# EasyEDA Pro project ProPrj_K230_2026-10-28.epro, board PCB1
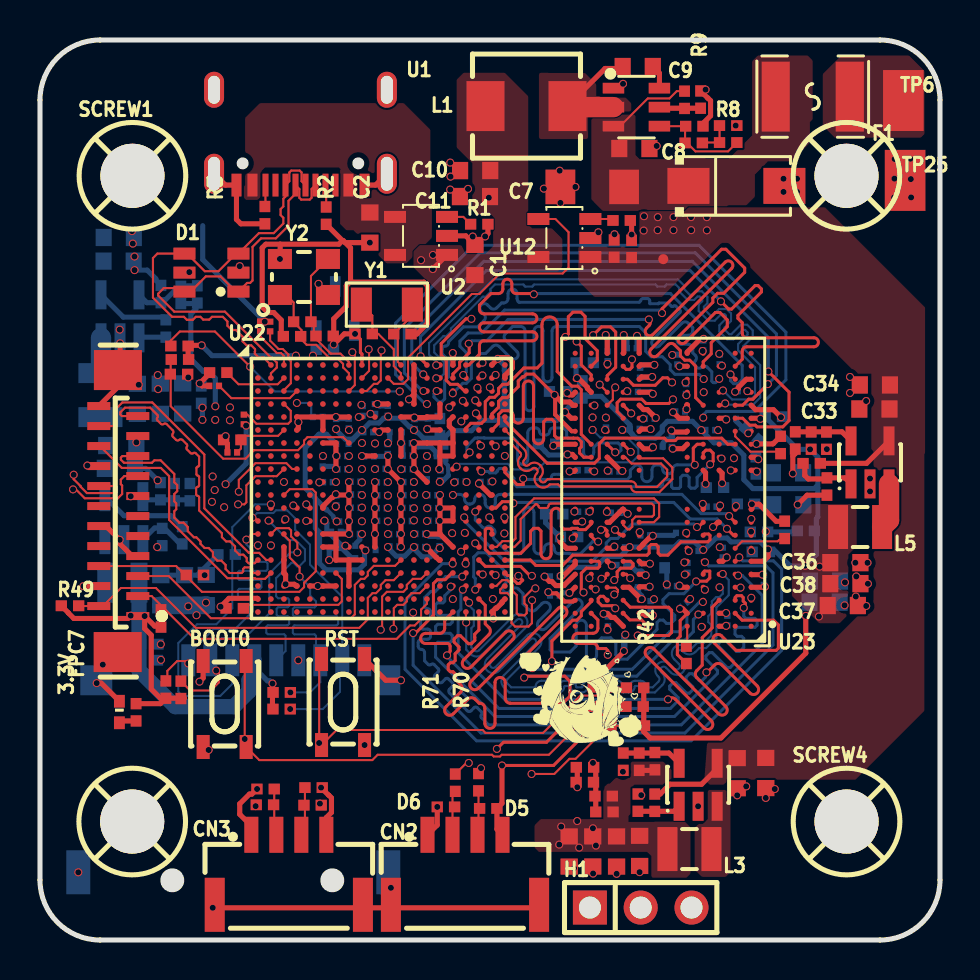
[diagram p13: board, top side]
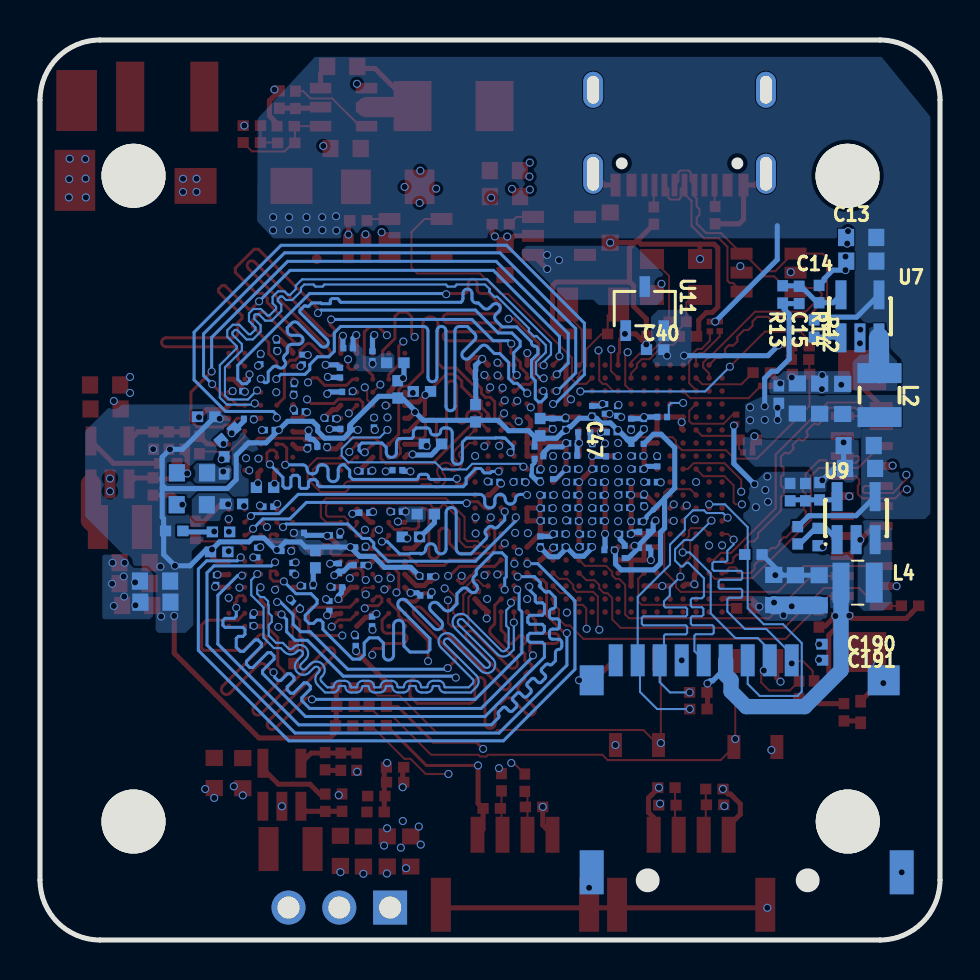
[diagram p14: board, bottom side, seen from below]

Outline 45 x 45 mm; copper layers: Top Layer, Inner1, Inner2, Inner3, Inner4, Bottom Layer. Coordinates in mm from the lower left corner of the outline.
Outline path: 0,42 0,3 arc(0.88,0.88) 3,0 42,0 arc(44.12,0.88) 45,3 45,42 arc(44.12,44.12) 42,45 3,45 arc(0.88,44.12) 0,42
Stack: Top Layer 0.035mm Outer layer thickness 1oz / Dielectric1 0.0994mm 3313 RC57% 4.2mil / Inner1 0.0152mm Inner layer thickness / Dielectric2 0.55mm 0.55mm H/H No copper / Inner2 0.0152mm Inner layer thickness / Dielectric3 0.1088mm 2116 RC54% 4.9mil / Inner3 0.0152mm Inner layer thickness / Dielectric4 0.55mm 0.55mm H/H No copper / Inner4 0.0152mm Inner layer thickness / Dielectric5 0.0994mm 3313 RC57% 4.2mil / Bottom Layer 0.035mm Outer layer thickness 1oz

## Design rules (mm)
net AVDD_0V8_PLL: PWR
net VDD0V8_CORE: PWR
net VAA_DDR: PWR
net VDD_1V8: PWR
net AVDD1P8_MIPI: PWR
net AVDD0P8_MIPI: PWR
net GND: PWR
net PRE_VDD_5V: PWR
net USB5V_IN+: PWR
net VDD_5V: PWR
net VDD_1V1: PWR
net VDD_3V3: PWR
net ADC_1V8_POWER: PWR
net DDR_VREF: PWR
net TFCARD_D1: TF_CRAD
net TFCARD_D0: TF_CRAD
net TFCARD_CLK: TF_CRAD
net TFCARD_CMD: TF_CRAD
net TFCARD_D3: TF_CRAD
net TFCARD_D2: TF_CRAD
net USB0_P: DP7
net USB0_N: DP7
net 8V-24V_IN+: PWR
net CSI2_CLK_P: DP10
net CSI2_CLK_N: DP10
net CSI2_D5_P: DP8
net CSI2_D5_N: DP8
net CSI2_D4_P: DP9
net CSI2_D4_N: DP9
net DDR_DQA6: Data_CH_A_Byte0
net DDR_DQSA0_P: Data_CH_A_Byte0, DP2
net DDR_DQA8: Data_CH_A_Byte1
net DDR_DQA7: Data_CH_A_Byte0
net DDR_DQSA0_N: Data_CH_A_Byte0, DP2
net DDR_DQA0: Data_CH_A_Byte0
net DDR_DQA13: Data_CH_A_Byte1
net DDR_DQA9: Data_CH_A_Byte1
net DDR_DQA3: Data_CH_A_Byte0
net DDR_DQA12: Data_CH_A_Byte1
net DDR_DQA11: Data_CH_A_Byte1
net DDR_DMIA1: Data_CH_A_Byte1
net DDR_DQA10: Data_CH_A_Byte1
net DDR_CSA0: CMD_ADDR_CH_A
net DDR_CLKA_N: CMD_ADDR_CH_A, DP3
net DDR_CLKA_P: CMD_ADDR_CH_A, DP3
net DDR_CAA5: CMD_ADDR_CH_A
net DDR_DQA14: Data_CH_A_Byte1
net DDR_DQA2: Data_CH_A_Byte0
net DDR_DQA4: Data_CH_A_Byte0
net DDR_DQA15: Data_CH_A_Byte1
net DDR_DQA5: Data_CH_A_Byte0
net DDR_DMIA0: Data_CH_A_Byte0
net DDR_DQA1: Data_CH_A_Byte0
net DDR_DQSA1_P: Data_CH_A_Byte1, DP4
net DDR_DQSA1_N: Data_CH_A_Byte1, DP4
net DDR_CAB2: CMD_ADDR_CH_B
net DDR_CAB4: CMD_ADDR_CH_B
net DDR_CAB3: CMD_ADDR_CH_B
net DDR_DQB12: Data_CH_B_Byte1
net DDR_DQB11: Data_CH_B_Byte1
net DDR_DMIB1: Data_CH_B_Byte1
net DDR_DQB10: Data_CH_B_Byte1
net DDR_DQB13: Data_CH_B_Byte1
net DDR_DQB4: Data_CH_B_Byte0
net DDR_DQB8: Data_CH_B_Byte1
net DDR_DQB9: Data_CH_B_Byte1
net DDR_DQB6: Data_CH_B_Byte0
net DDR_DMIB0: Data_CH_B_Byte0
net DDR_DQB2: Data_CH_B_Byte0
net DDR_DQSB1_P: Data_CH_B_Byte1, DP5
net DDR_DQB7: Data_CH_B_Byte0
net DDR_DQB5: Data_CH_B_Byte0
net DDR_DQSB0_P: Data_CH_B_Byte0, DP6
net DDR_DQB3: Data_CH_B_Byte0
net DDR_DQSB1_N: Data_CH_B_Byte1, DP5
net DDR_DQB1: Data_CH_B_Byte0
net DDR_DQSB0_N: Data_CH_B_Byte0, DP6
net DDR_DQB0: Data_CH_B_Byte0
net DDR_CLKB_P: CMD_ADDR_CH_B, DP1
net DDR_CAB1: CMD_ADDR_CH_B
net DDR_CLKB_N: CMD_ADDR_CH_B, DP1
net DDR_CAB5: CMD_ADDR_CH_B
net DDR_CAB0: CMD_ADDR_CH_B
net DDR_DQB14: Data_CH_B_Byte1
net DDR_DQB15: Data_CH_B_Byte1
net DDR_CAA1: CMD_ADDR_CH_A
net DDR_CKEA0: CMD_ADDR_CH_A
net DDR_CAA4: CMD_ADDR_CH_A
net DDR_CKEB0: CMD_ADDR_CH_B
net DDR_CAA3: CMD_ADDR_CH_A
net DDR_CAA2: CMD_ADDR_CH_A
net DDR_CAA0: CMD_ADDR_CH_A
net DDR_CSB0: CMD_ADDR_CH_B
spacing copperThickness1oz (default): track to track 0.102, other pairs 0.102 to 0.3
spacing copperThickness2oz: track to track 0.203, other pairs 0.152 to 0.3
track width copperThickness1oz (default): min 0.102, default 0.102, max 2.54
track width copperThickness2oz: min 0.203, default 0.254, max 2.54
track width DDR: min 0.127, default 0.15, max 2.54
track width Pwr: min 0.127, default 0.254, max 2.54
differential pair differentialPair (default): width min 0.025, default 0.107, max 2.54; gap min 0.152, default 0.152
net AVDD_0V8_PLL uses Pwr
net VDD0V8_CORE uses Pwr
net VAA_DDR uses Pwr
net VDD_1V8 uses Pwr, copperRegion
net AVDD1P8_MIPI uses Pwr
net AVDD0P8_MIPI uses Pwr
net GND uses Pwr, copperRegion
net PRE_VDD_5V uses Pwr
net USB5V_IN+ uses Pwr
net VDD_5V uses Pwr
net VDD_1V1 uses Pwr, copperRegion
net VDD_3V3 uses Pwr
net ADC_1V8_POWER uses Pwr
net DDR_VREF uses Pwr
net 8V-24V_IN+ uses Pwr
net $15N1275 uses copperRegion
net DDR_DQA6 uses DDR
net DDR_DQSA0_P uses DDR
net DDR_DQA8 uses DDR
net DDR_DQA7 uses DDR
net DDR_DQSA0_N uses DDR
net DDR_DQA0 uses DDR
net DDR_DQA13 uses DDR
net DDR_DQA9 uses DDR
net DDR_DQA3 uses DDR
net DDR_DQA12 uses DDR
net DDR_DQA11 uses DDR
net DDR_DMIA1 uses DDR
net DDR_DQA10 uses DDR
net DDR_CSA0 uses DDR
net DDR_CLKA_N uses DDR
net DDR_CLKA_P uses DDR
net DDR_CAA5 uses DDR
net DDR_DQA14 uses DDR
net DDR_DQA2 uses DDR
net DDR_DQA4 uses DDR
net DDR_DQA15 uses DDR
net DDR_DQA5 uses DDR
net DDR_DMIA0 uses DDR
net DDR_DQA1 uses DDR
net DDR_DQSA1_P uses DDR
net DDR_DQSA1_N uses DDR
net DDR_CAB2 uses DDR
net DDR_CAB4 uses DDR
net DDR_CAB3 uses DDR
net DDR_DQB12 uses DDR
net DDR_DQB11 uses DDR
net DDR_DMIB1 uses DDR
net DDR_DQB10 uses DDR
net DDR_DQB13 uses DDR
net DDR_DQB4 uses DDR
net DDR_DQB8 uses DDR
net DDR_DQB9 uses DDR
net DDR_DQB6 uses DDR
net DDR_DMIB0 uses DDR
net DDR_DQB2 uses DDR
net DDR_DQSB1_P uses DDR
net DDR_DQB7 uses DDR
net DDR_DQB5 uses DDR
net DDR_DQSB0_P uses DDR
net DDR_DQB3 uses DDR
net DDR_DQSB1_N uses DDR
net DDR_DQB1 uses DDR
net DDR_DQSB0_N uses DDR
net DDR_DQB0 uses DDR
net DDR_CLKB_P uses DDR
net DDR_CAB1 uses DDR
net DDR_CLKB_N uses DDR
net DDR_CAB5 uses DDR
net DDR_CAB0 uses DDR
net DDR_DQB14 uses DDR
net DDR_DQB15 uses DDR
net DDR_CAA1 uses DDR
net DDR_CKEA0 uses DDR
net DDR_CAA4 uses DDR
net DDR_CKEB0 uses DDR
net DDR_CAA3 uses DDR
net DDR_CAA2 uses DDR
net DDR_CAA0 uses DDR
net DDR_CSB0 uses DDR
net class Data_CH_A_Byte0 uses DDR
net class Data_CH_A_Byte1 uses DDR
net class Data_CH_B_Byte0 uses DDR
net class Data_CH_B_Byte1 uses DDR
net class CMD_ADDR_CH_A uses DDR
net class CMD_ADDR_CH_B uses DDR
net class PWR uses Pwr

## Placement (name value [footprint] x y rotation side)
3.3V  NCD0402R1  [LED0402-RD]  3.97 11.4 270 top
B1  BLM03PX121SN1D  [R0201_1]  17.79 25.39 90 bottom
B2  BLM03PX121SN1D  [R0201_1]  20.27 24.36 180 bottom
B3  BLM03PX121SN1D  [R0201_1]  15.12 24.81 90 bottom
B4  BLM03PX121SN1D  [R0201_1]  15.76 19.4 180 bottom
BOOT0  TSA016A2518C  [SW-SMD_4P-L4.2-W3.3-P2.15-LS4.6]  9.23 11.8 270 top
C1  10uF  [R0603]  21.75 34 90 top
C2  10uF  [R0603]  16.49 35.62 270 top
C3  100nF  [R0201]  18.37 21.61 180 bottom
C7  10uF  [C1206]  27.61 37.66 0 top
C8  100nF  [R0603]  29.72 39.57 180 top
C9  100nF  [R0603]  29.89 43.67 0 top
C10  22uF  [R0603]  21.76 38.47 0 top
C11  22uF  [R0603]  21.75 37.17 0 top
C12  75pF  [R0402]  34.41 39.87 180 top
C13  22uF  [R0603]  3.94 35.13 0 bottom
C14  22uF  [R0603]  3.93 33.94 0 bottom
C15  47pF  [R0402]  7.04 32.25 90 bottom
C16  22uF  [R0603]  7.13 27.08 90 bottom
C17  22uF  [R0603]  6.02 27.06 90 bottom
C18  22uF  [R0603]  4.87 27.06 90 bottom
C19  22uF  [R0603]  34.86 8.34 270 top
C20  22uF  [R0603]  36.29 8.35 270 top
C21  47pF  [R0402]  30.74 8.94 90 top
C22  22uF  [R0603]  28.83 4.42 270 top
C23  22uF  [R0603]  26.46 4.42 270 top
C24  22uF  [R0603]  27.64 4.43 270 top
C25  100nF  [R0402]  29.89 6.87 270 top
C26  22uF  [R0603]  4.07 24.72 0 bottom
C27  22uF  [R0603]  3.99 23.58 0 bottom
C28  47pF  [R0402]  6.73 22.39 270 bottom
C29  22uF  [R0603]  8.31 17.5 270 bottom
C30  22uF  [R0603]  6.04 17.49 270 bottom
C31  22uF  [R0603]  7.23 17.49 270 bottom
C32  100nF  [R0402]  6.11 20.15 90 bottom
C33  22uF  [R0603]  41.72 26.55 180 top
C34  22uF  [R0603]  41.74 27.75 180 top
C35  47pF  [R0402]  38.56 24.97 90 top
C36  22uF  [R0603]  40.27 18.87 0 top
C37  22uF  [R0603]  40.14 16.72 0 top
C38  22uF  [R0603]  40.27 17.82 0 top
C39  100nF  [R0402]  39.35 22.67 90 top
C40  4.7uF  [R0402]  14.24 29.52 180 bottom
C41  27pF  [R0402]  16.19 30.31 0 top
C42  27pF  [R0402]  18.12 30.3 180 top
C43  20pF  [R0402]  12.6 30.18 0 top
C44  20pF  [R0402]  14.23 30.2 180 top
C45  100nF  [R0402]  7 29.02 0 top
C46  100nF  [R0402]  28.1 12.64 180 top
C47  100nF  [R0201]  17.39 26.46 90 bottom
C48  100nF  [R0201]  33.52 25.5 0 bottom
C50  4.7uF  [R0402]  9.61 25.01 180 top
C51  100nF  [R0201]  9.61 24.38 180 top
C52  100nF  [R0201]  14.82 21.98 90 bottom
C53  100nF  [R0201]  17.72 19.68 0 bottom
C54  100nF  [R0201]  19.01 19.65 0 bottom
C55  100nF  [R0201]  19.98 19.94 90 bottom
C56  100nF  [R0201]  16.13 26.45 90 bottom
C57  100nF  [R0201]  16.75 26.55 90 bottom
C60  4.7uF  [R0402]  8.06 27.27 90 bottom
C61  100nF  [R0201]  16.46 24.18 0 bottom
C62  100nF  [R0201]  18.35 20.95 180 bottom
C63  100nF  [R0201]  15.79 21.61 180 bottom
C64  100nF  [R0201]  15.75 20.3 180 bottom
C65  100nF  [R0201]  15.11 24.2 180 bottom
C66  100nF  [R0201]  17.1 20.96 180 bottom
C67  100nF  [R0201]  17.71 20.29 0 bottom
C68  100nF  [R0201]  18.42 22.24 180 bottom
C69  100nF  [R0201]  17.09 21.59 180 bottom
C70  100nF  [R0201]  17.11 22.23 180 bottom
C71  100nF  [R0201]  18.39 23.54 0 bottom
C72  100nF  [R0201]  18.38 24.22 0 bottom
C73  100nF  [R0201]  18.41 22.9 180 bottom
C74  100nF  [R0201]  18.35 24.84 0 bottom
C75  100nF  [R0201]  19.01 20.3 0 bottom
C76  100nF  [R0201]  15.79 22.28 180 bottom
C77  100nF  [R0201]  17.09 22.88 180 bottom
C78  100nF  [R0201]  17.04 23.56 0 bottom
C79  100nF  [R0201]  15.78 22.91 180 bottom
C80  100nF  [R0201]  15.12 23.54 180 bottom
C81  22uF  [R0402]  29.58 34.56 90 top
C82  22uF  [R0402]  28.71 34.57 90 top
C83  4.7uF  [R0402]  25.71 21.3 180 bottom
C84  100nF  [R0201]  19.34 23.29 270 bottom
C85  100nF  [R0201]  19.59 24.19 0 bottom
C86  100nF  [R0201]  19.62 22.24 0 bottom
C87  100nF  [R0201]  19.67 20.96 0 bottom
C88  100nF  [R0201]  19.66 21.59 0 bottom
C89  100nF  [R0201]  17.39 24.55 270 bottom
C90  100nF  [R0201]  20.03 23.23 90 bottom
C91  100nF  [R0201]  14.14 23.92 270 bottom
C92  100nF  [R0201]  14.4 22.89 180 bottom
C93  100nF  [R0201]  16.42 25.39 0 bottom
C94  100nF  [R0201]  14.81 25.8 90 bottom
C95  100nF  [R0201]  18.73 25.8 90 bottom
C96  100nF  [R0201]  19.39 25.83 90 bottom
C97  100nF  [R0201]  15.44 25.82 90 bottom
C98  100nF  [R0402]  28.22 6.4 180 top
C99  100nF  [R0402]  27.25 8.64 180 top
C100  100nF  [R0201]  21.04 22.93 180 bottom
C101  22uF  [R0603]  39.25 17.95 0 bottom
C102  22uF  [R0603]  39.23 16.89 0 bottom
C103  4.7uF  [R0402]  19.99 25.64 90 bottom
C104  4.7uF  [R0402]  38.29 20.45 180 bottom
C105  100nF  [R0402]  36.04 19.41 180 bottom
C106  100nF  [R0402]  31.23 19.04 270 bottom
C107  100nF  [R0402]  23.22 26.33 90 bottom
C108  100nF  [R0402]  36.69 26.16 0 bottom
C109  100nF  [R0402]  27.11 27.53 90 bottom
C110  100nF  [R0201]  25.74 18.17 180 bottom
C111  100nF  [R0201]  32.68 19.46 180 bottom
C112  100nF  [R0201]  29 19.63 180 bottom
C113  100nF  [R0201]  29.74 25.55 0 bottom
C114  22uF  [R0603]  37.41 21.76 0 bottom
C115  4.7uF  [R0603]  37.4 23.36 0 bottom
C116  100nF  [R0201]  27.15 21.41 0 bottom
C117  100nF  [R0201]  33.16 29.73 90 bottom
C118  100nF  [R0201]  27.13 23.49 0 bottom
C119  100nF  [R0201]  28.73 23.43 0 bottom
C120  100nF  [R0201]  34.14 19.38 90 bottom
C121  100nF  [R0201]  29.07 18.75 0 bottom
C122  100nF  [R0201]  30.06 18.59 270 bottom
C123  100nF  [R0201]  30.13 17.63 180 bottom
C124  100nF  [R0201]  34.56 26.06 0 bottom
C125  100nF  [R0201]  28.38 29.19 90 bottom
C126  100nF  [R0201]  30.26 20.23 0 bottom
C127  100nF  [R0201]  28.79 21.36 0 bottom
C128  100nF  [R0201]  29.59 29.59 0 bottom
C129  100nF  [R0201]  25.74 17.23 180 bottom
C130  100nF  [R0201]  30 28.37 270 bottom
C131  22uF  [R0603]  29.98 4.45 270 top
C132  4.7uF  [R0402]  27.24 28.86 180 bottom
C133  100nF  [R0201]  28.4 15.93 270 bottom
C134  100nF  [R0201]  32.37 18.61 270 bottom
C135  100nF  [R0201]  31.6 17.69 180 bottom
C136  100nF  [R0201]  29.21 14.95 270 bottom
C137  100nF  [R0201]  30.53 16.7 90 bottom
C138  100nF  [R0201]  31.87 29.02 90 bottom
C139  100nF  [R0201]  28.3 25.87 270 bottom
C140  100nF  [R0201]  29.65 27.41 180 bottom
C141  100nF  [R0201]  32.3 27.55 90 bottom
C142  100nF  [R0201]  35.13 27.44 180 bottom
C143  100nF  [R0201]  33.58 21.67 180 bottom
C144  100nF  [R0201]  30.89 24.68 0 bottom
C145  100nF  [R0201]  32.04 20.36 180 bottom
C146  100nF  [R0402]  26.46 20.16 180 bottom
C147  100nF  [R0402]  35.95 20.4 0 bottom
C148  100nF  [R0402]  35.63 25.27 139 bottom
C149  100nF  [R0402]  33.75 22.62 180 bottom
C150  100nF  [R0402]  25.35 24.8 180 bottom
C151  100nF  [R0402]  35.3 21.8 180 bottom
C152  100nF  [R0402]  25.91 27.43 180 bottom
C153  100nF  [R0402]  35.79 23.73 90 bottom
C154  100nF  [R0201]  30.49 26.07 0 bottom
C155  100nF  [R0201]  34.37 15.97 270 bottom
C156  100nF  [R0201]  33.99 29.03 90 bottom
C157  100nF  [R0201]  36.19 18 90 bottom
C158  100nF  [R0201]  32.2 16.77 38.3 bottom
C159  100nF  [R0201]  32.01 26.42 0 bottom
C160  100nF  [R0201]  31.6 24.9 90 bottom
C161  100nF  [R0201]  16.54 19.5 0 bottom
C162  100nF  [R0201]  15.21 20.92 0 bottom
C163  100nF  [R0201]  14.8 20.4 180 bottom
C164  100nF  [R0201]  14.8 19.61 0 bottom
C190  10uF  [R0402]  5.47 14.79 0 bottom
C191  100nF  [R0402]  5.44 13.99 0 bottom
CARD1  XKTF-015-G  [TF-SMD_XKTF-015-N]  9.66 8.69 180 bottom
CN2  GH125-S04DCA-00  [CONN-SMD_4P-P1.27_GH125-S04DCA-00]  21.25 3.51 0 top
CN3  GH125-S04DCA-00  [CONN-SMD_4P-P1.27_GH125-S04DCA-00]  12.44 3.51 0 top
D1  BST236A054U  [SOT-23-6_L2.9-W1.6-P0.95-LS2.8-BR]  8.57 33.37 0 top
D3  SMAJ24A  [SMA_L4.3-W2.7-LS5.1-RD]  34.82 37.7 0 top
D5  KLXES15AAA1  [R0402_1]  22.41 6.58 180 top
D6  KLXES15AAA1  [R0402_1]  20.3 6.65 0 top
D7  KLXES15AAA1  [R0402_1]  13.68 7.62 180 top
D8  KLXES15AAA1  [R0402_1]  11.28 7.55 0 top
F1  BSMD1812-200-30V  [F1812]  38.64 42.17 180 top
FPC7  AFC11-S22ICA-00  [FPC-SMD_22P-P1.00_AFC11-S22ICC-00]  3.92 21.45 90 top
H1  -  [HDR-TH_3P-P2.54-V-M]  30.04 1.62 0 top
L1  10uH  [IND-SMD_L5.4-W5.2_FXL0530]  24.32 41.7 180 top
L2  2.2uH  [IND-SMD_L2.5-W2.0_MHCHL2520]  3.02 27.24 270 bottom
L3  2.2uH  [IND-SMD_L2.5-W2.0_MHCHL2520]  32.47 4.55 180 top
L4  4.7uH  [IND-SMD_L2.5-W2.0-VLS252012CX-150M]  4.12 17.87 0 bottom
L5  2.2uH  [IND-SMD_L2.5-W2.0_MHCHL2520]  41.01 20.65 180 top
R1  3.4kΩ  [R0402]  21.96 35.79 0 top
R2  5.1kΩ  [R0402_3]  14.31 36.22 270 top
R3  5.1kΩ  [R0402_3]  11.24 36.24 270 top
R7  511kΩ  [R0402]  32.23 42.01 90 top
R8  49.9Ω  [R0402]  34.41 40.72 0 top
R9  105kΩ  [R0402]  33.03 42.02 270 top
R10  100kΩ  [R0402_1]  32.69 39.85 0 top
R11  13.3kΩ  [R0402]  32.72 40.69 180 top
R12  10kΩ  [R0402]  6.29 30.57 270 bottom
R13  33.2kΩ  [R0402]  7.87 32.28 90 bottom
R14  100kΩ  [R0402]  6.05 32.3 90 bottom
R15  10kΩ  [R0402]  30.74 6.86 270 top
R16  100kΩ  [R0402]  29.96 8.91 90 top
R17  120kΩ  [R0402]  29.16 8.91 270 top
R18  10kΩ  [R0402]  7.11 20.23 270 bottom
R19  300kΩ  [R0402]  7.49 22.39 270 bottom
R20  66.5kΩ  [R0402]  6.02 22.44 90 bottom
R21  10kΩ  [R0402]  38.58 23.83 180 top
R22  200kΩ  [R0402]  39.32 24.97 90 top
R23  100kΩ  [R0402]  37.76 24.98 270 top
R24  4.7kΩ  [R0402]  29.08 35.98 0 top
R25  NC  [R0402]  13.11 30.91 0 top
R26  10kΩ/NC  [R0201]  10.2 26.03 270 top
R27  10kΩ  [R0402]  8.91 28.37 180 top
R28  30kΩ  [R0201]  11.51 30.67 90 top
R29  30kΩ  [R0201]  11.01 30.68 90 top
R30  200Ω  [R0201]  13.89 26.15 0 bottom
R31  200Ω  [R0201]  8.71 27.71 180 top
R32  100kΩ  [R0402]  29.76 12.61 180 top
R33  10kΩ  [R0402]  29.73 11.67 180 top
R34  10kΩ  [R0402]  29.79 10.72 180 top
R35  10kΩ  [R0402]  6.97 29.7 180 top
R36  0Ω  [R0402]  6.95 28.29 180 top
R37  NC  [R0402]  28.11 11.67 180 top
R38  NC  [R0402]  28.12 10.73 180 top
R39  0Ω  [R0402]  37.23 20.51 90 top
R40  240Ω  [R0201]  22.28 22.9 180 bottom
R41  0Ω  [R0402]  37.03 24.75 90 top
R42  240Ω  [R0402]  32.32 14.26 270 top
R43  1kΩ  [R0402]  28.18 7.19 180 top
R44  1kΩ  [R0402]  27.24 7.89 180 top
R45  200Ω  [R0402]  9.74 16.58 0 top
R46  10kΩ  [R0402]  7.74 18.25 180 top
R48  4.7kΩ  [R0402]  6.05 16.08 90 top
R49  4.7kΩ  [R0402]  1.5 16.71 0 top
R70  0402WGF1000TCE  [R0402_1]  21.93 7.89 270 top
R71  0402WGF1000TCE  [R0402_1]  20.76 7.86 270 top
R73  2kΩ  [R0402_3]  4.8 11.38 90 top
R76  0402WGF1000TCE  [R0402_1]  13.63 6.74 180 top
R77  0402WGF1000TCE  [R0402_1]  11.25 6.76 0 top
R82  10kΩ  [R0402]  9.33 19.28 180 bottom
R83  10kΩ  [R0402]  12.09 12.38 180 top
R84  10kΩ  [R0402]  12.08 11.55 180 top
R85  10kΩ  [R0402]  6.29 12.52 270 top
R86  10kΩ  [R0402]  7.04 12.51 270 top
RST  TSA016A2518C  [SW-SMD_4P-L4.2-W3.3-P2.15-LS4.6]  15.15 11.9 90 top
SCREW1  -  [M3螺丝]  4.62 38.21 0 top
SCREW2  -  [M3螺丝]  4.61 5.92 0 top
SCREW3  -  [M3螺丝]  40.32 38.21 0 top
SCREW4  -  [M3螺丝]  40.33 5.92 0 top
TP6  -  [Test-Point-0.5mm_1]  43.17 41.97 0 top
TP8  VDD_5V  [Test-Point-0.5mm]  31.16 34.04 0 top
TP11  VDD_3V3  [Test-Point-0.5mm]  4.94 16.22 180 bottom
TP25  -  [Test-Point-0.5mm_1]  43.26 37.98 0 top
U1  USB-TYPE-C-019  [TYPE-C-SMD_HX-TYPE-C-16PIN]  13.02 40.13 180 top
U2  MT9700  [SOT-23-5_L3.0-W1.7-P0.95-LS2.8-BR]  19.05 35.21 0 top
U6  TPS54302DDCR  [SOT-23-6_L2.9-W1.6-P0.95-LS2.8-BL]  29.82 41.64 270 top
U7  TLV62569DBVR  [SOT23-5]  4 31.18 180 bottom
U8  TLV62569DBVR  [SOT23-5]  32.91 7.76 0 top
U9  TLV62569DBVR  [SOT23-5]  4.19 21.09 180 bottom
U10  TLV62569DBVR  [SOT23-5]  41.5 23.88 0 top
U11  XC6206P182MR  [SOT-23-3_L3.0-W1.7-P0.95-LS2.9-BR]  14.76 31.57 270 bottom
U12  MT9700  [SOT-23-5_L3.0-W1.7-P0.95-LS2.8-BR]  26.22 35.1 0 top
U22  -  [K230]  17.07 22.58 0 top
U23  K4F8E304HB-MGCJ  [BGA-200_L15.0-W10.0_K4F8E304HB-MGCJ]  31.16 22.51 180 top
Y1  32.768kHz  [OSC-SMD_L3.2-W1.5]  17.34 31.77 180 top
Y2  24MHz  [XTAL_3225]  13.2 33.15 180 top

## Footprints (pads in the part's own frame, mm; a bottom-side part is the same pattern mirrored in y, then rotated)
BGA-200_L15.0-W10.0_K4F8E304HB-MGCJ
  round 0.254 smd: A1(-4.4,6.825) A2(-3.6,6.825) A3(-2.8,6.825) A4(-2,6.825) A5(-1.2,6.825) A8(1.2,6.825) A9(2,6.825) A10(2.8,6.825) A11(3.6,6.825) A12(4.4,6.825) AA1(-4.4,-6.175) AA2(-3.6,-6.175) AA3(-2.8,-6.175) AA4(-2,-6.175) AA5(-1.2,-6.175) AA8(1.2,-6.175) AA9(2,-6.175) AA10(2.8,-6.175) AA11(3.6,-6.175) AA12(4.4,-6.175) AB1(-4.4,-6.825) AB2(-3.6,-6.825) AB3(-2.8,-6.825) AB4(-2,-6.825) AB5(-1.2,-6.825) AB8(1.2,-6.825) AB9(2,-6.825) AB10(2.8,-6.825) AB11(3.6,-6.825) AB12(4.4,-6.825) B1(-4.4,6.175) B2(-3.6,6.175) B3(-2.8,6.175) B4(-2,6.175) B5(-1.2,6.175) B8(1.2,6.175) B9(2,6.175) B10(2.8,6.175) B11(3.6,6.175) B12(4.4,6.175) C1(-4.4,5.525) C2(-3.6,5.525) C3(-2.8,5.525) C4(-2,5.525) C5(-1.2,5.525) C8(1.2,5.525) C9(2,5.525) C10(2.8,5.525) C11(3.6,5.525) C12(4.4,5.525) D1(-4.4,4.875) D2(-3.6,4.875) D3(-2.8,4.875) D4(-2,4.875) D5(-1.2,4.875) D8(1.2,4.875) D9(2,4.875) D10(2.8,4.875) D11(3.6,4.875) D12(4.4,4.875) E1(-4.4,4.225) E2(-3.6,4.225) E3(-2.8,4.225) E4(-2,4.225) E5(-1.2,4.225) E8(1.2,4.225) E9(2,4.225) E10(2.8,4.225) E11(3.6,4.225) E12(4.4,4.225) F1(-4.4,3.575) F2(-3.6,3.575) F3(-2.8,3.575) F4(-2,3.575) F5(-1.2,3.575) F8(1.2,3.575) F9(2,3.575) F10(2.8,3.575) F11(3.6,3.575) F12(4.4,3.575) G1(-4.4,2.925) G2(-3.6,2.925) G3(-2.8,2.925) G4(-2,2.925) G5(-1.2,2.925) G8(1.2,2.925) G9(2,2.925) G10(2.8,2.925) G11(3.6,2.925) G12(4.4,2.925) H1(-4.4,2.275) H2(-3.6,2.275) H3(-2.8,2.275) H4(-2,2.275) H5(-1.2,2.275) H8(1.2,2.275) H9(2,2.275) H10(2.8,2.275) H11(3.6,2.275) H12(4.4,2.275) J1(-4.4,1.625) J2(-3.6,1.625) J3(-2.8,1.625) J4(-2,1.625) J5(-1.2,1.625) J8(1.2,1.625) J9(2,1.625) J10(2.8,1.625) J11(3.6,1.625) J12(4.4,1.625) K1(-4.4,0.975) K2(-3.6,0.975) K3(-2.8,0.975) K4(-2,0.975) K5(-1.2,0.975) K8(1.2,0.975) K9(2,0.975) K10(2.8,0.975) K11(3.6,0.975) K12(4.4,0.975) N1(-4.4,-0.975) N2(-3.6,-0.975) N3(-2.8,-0.975) N4(-2,-0.975) N5(-1.2,-0.975) N8(1.2,-0.975) N9(2,-0.975) N10(2.8,-0.975) N11(3.6,-0.975) N12(4.4,-0.975) P1(-4.4,-1.625) P2(-3.6,-1.625) P3(-2.8,-1.625) P4(-2,-1.625) P5(-1.2,-1.625) P8(1.2,-1.625) P9(2,-1.625) P10(2.8,-1.625) P11(3.6,-1.625) P12(4.4,-1.625) R1(-4.4,-2.275) R2(-3.6,-2.275) R3(-2.8,-2.275) R4(-2,-2.275) R5(-1.2,-2.275) R8(1.2,-2.275) R9(2,-2.275) R10(2.8,-2.275) R11(3.6,-2.275) R12(4.4,-2.275) T1(-4.4,-2.925) T2(-3.6,-2.925) T3(-2.8,-2.925) T4(-2,-2.925) T5(-1.2,-2.925) T8(1.2,-2.925) T9(2,-2.925) T10(2.8,-2.925) T11(3.6,-2.925) T12(4.4,-2.925) U1(-4.4,-3.575) U2(-3.6,-3.575) U3(-2.8,-3.575) U4(-2,-3.575) U5(-1.2,-3.575) U8(1.2,-3.575) U9(2,-3.575) U10(2.8,-3.575) U11(3.6,-3.575) U12(4.4,-3.575) V1(-4.4,-4.225) V2(-3.6,-4.225) V3(-2.8,-4.225) V4(-2,-4.225) V5(-1.2,-4.225) V8(1.2,-4.225) V9(2,-4.225) V10(2.8,-4.225) V11(3.6,-4.225) V12(4.4,-4.225) W1(-4.4,-4.875) W2(-3.6,-4.875) W3(-2.8,-4.875) W4(-2,-4.875) W5(-1.2,-4.875) W8(1.2,-4.875) W9(2,-4.875) W10(2.8,-4.875) W11(3.6,-4.875) W12(4.4,-4.875) Y1(-4.4,-5.525) Y2(-3.6,-5.525) Y3(-2.8,-5.525) Y4(-2,-5.525) Y5(-1.2,-5.525) Y8(1.2,-5.525) Y9(2,-5.525) Y10(2.8,-5.525) Y11(3.6,-5.525) Y12(4.4,-5.525)
C1206
  rect 1.485x1.728 smd: 1(-1.593,0) 2(1.593,0)
CONN-SMD_4P-P1.27_GH125-S04DCA-00
  rect 0.7x1.8 smd: 1(-1.875,1.75) 2(-0.625,1.75) 3(0.625,1.75) 4(1.875,1.75)
  rect 1x2.7 smd: 5(3.705,-1.75) 6(-3.705,-1.75)
F1812
  rect 1.407x3.499 smd: 1(-1.853,0) 2(1.853,0)
FPC-SMD_22P-P1.00_AFC11-S22ICC-00
  rect 0.4x1.15 smd: 1(-5.25,-0.975) 2(-4.75,0.975) 3(-4.25,-0.975) 4(-3.75,0.975) 5(-3.25,-0.975) 6(-2.75,0.975) 7(-2.25,-0.975) 8(-1.75,0.975) 9(-1.25,-0.975) 10(-0.75,0.975) 11(-0.25,-0.975) 12(0.25,0.975) 13(0.75,-0.975) 14(1.25,0.975) 15(1.75,-0.975) 16(2.25,0.975) 17(2.75,-0.975) 18(3.25,0.975) 19(3.75,-0.975) 20(4.25,0.975) 21(4.75,-0.975) 22(5.25,0.975)
  rect 2x2.4 smd: 23(7.05,0.021) 24(-7.05,0.029)
HDR-TH_3P-P2.54-V-M
  rect 1.7x1.7 hole 1.1: 1(-2.54,0)
  round 1.7 hole 1.1: 2(0,0) 3(2.54,0)
IND-SMD_L2.5-W2.0-VLS252012CX-150M
  rect 0.85x2 smd: 1(-0.83,0) 2(0.83,0)
IND-SMD_L2.5-W2.0_MHCHL2520
  rect 1x2.2 smd: 1(-1.1,0) 2(1.1,0)
IND-SMD_L5.4-W5.2_FXL0530
  rect 1.9x2.5 smd: 1(-2.05,0) 2(2.05,0)
K230
  round 0.28 smd: A2(-5.525,6.175) A3(-4.875,6.175) A4(-4.225,6.175) A5(-3.575,6.175) A6(-2.925,6.175) A7(-2.275,6.175) A8(-1.625,6.175) A9(-0.975,6.175) A10(-0.325,6.175) A11(0.325,6.175) A12(0.975,6.175) A13(1.625,6.175) A14(2.275,6.175) A15(2.925,6.175) A16(3.575,6.175) A17(4.225,6.175) A18(4.875,6.175) A19(5.525,6.175) A20(6.175,6.175) B1(-6.175,5.525) B2(-5.525,5.525) B3(-4.875,5.525) B4(-4.225,5.525) B5(-3.575,5.525) B6(-2.925,5.525) B7(-2.275,5.525) B8(-1.625,5.525) B9(-0.975,5.525) B10(-0.325,5.525) B11(0.325,5.525) B12(0.975,5.525) B13(1.625,5.525) B14(2.275,5.525) B15(2.925,5.525) B16(3.575,5.525) B17(4.225,5.525) B18(4.875,5.525) B19(5.525,5.525) B20(6.175,5.525) C1(-6.175,4.875) C2(-5.525,4.875) C3(-4.875,4.875) C4(-4.225,4.875) C5(-3.575,4.875) C6(-2.925,4.875) C7(-2.275,4.875) C8(-1.625,4.875) C9(-0.975,4.875) C10(-0.325,4.875) C11(0.325,4.875) C12(0.975,4.875) C13(1.625,4.875) C14(2.275,4.875) C15(2.925,4.875) C16(3.575,4.875) C17(4.225,4.875) C18(4.875,4.875) C19(5.525,4.875) C20(6.175,4.875) D1(-6.175,4.225) D2(-5.525,4.225) D3(-4.875,4.225) D4(-4.225,4.225) D5(-3.575,4.225) D6(-2.925,4.225) D7(-2.275,4.225) D8(-1.625,4.225) D9(-0.975,4.225) D10(-0.325,4.225) D11(0.325,4.225) D12(0.975,4.225) D13(1.625,4.225) D14(2.275,4.225) D15(2.925,4.225) D16(3.575,4.225) D17(4.225,4.225) D18(4.875,4.225) D19(5.525,4.225) D20(6.175,4.225) E1(-6.175,3.575) E2(-5.525,3.575) E3(-4.875,3.575) E4(-4.225,3.575) E6(-2.925,3.575) E7(-2.275,3.575) E8(-1.625,3.575) E9(-0.975,3.575) E10(-0.325,3.575) E11(0.325,3.575) E12(0.975,3.575) E13(1.625,3.575) E14(2.275,3.575) E15(2.925,3.575) E16(3.575,3.575) E17(4.225,3.575) E18(4.875,3.575) E19(5.525,3.575) E20(6.175,3.575) F1(-6.175,2.925) F2(-5.525,2.925) F3(-4.875,2.925) F4(-4.225,2.925) F6(-2.925,2.925) F7(-2.275,2.925) F8(-1.625,2.925) F9(-0.975,2.925) F10(-0.325,2.925) F11(0.325,2.925) F12(0.975,2.925) F13(1.625,2.925) F14(2.275,2.925) F15(2.925,2.925) F16(3.575,2.925) F17(4.225,2.925) F18(4.875,2.925) F19(5.525,2.925) F20(6.175,2.925) G1(-6.175,2.275) G2(-5.525,2.275) G3(-4.875,2.275) G4(-4.225,2.275) G5(-3.575,2.275) G6(-2.925,2.275) G7(-2.275,2.275) G8(-1.625,2.275) G9(-0.975,2.275) G10(-0.325,2.275) G11(0.325,2.275) G12(0.975,2.275) G13(1.625,2.275) G14(2.275,2.275) G15(2.925,2.275) G16(3.575,2.275) G17(4.225,2.275) G18(4.875,2.275) G19(5.525,2.275) G20(6.175,2.275) H1(-6.175,1.625) H2(-5.525,1.625) H3(-4.875,1.625) H4(-4.225,1.625) H5(-3.575,1.625) H6(-2.925,1.625) H7(-2.275,1.625) H8(-1.625,1.625) H9(-0.975,1.625) H10(-0.325,1.625) H11(0.325,1.625) H12(0.975,1.625) H13(1.625,1.625) H14(2.275,1.625) H15(2.925,1.625) H16(3.575,1.625) H17(4.225,1.625) H18(4.875,1.625) H19(5.525,1.625) H20(6.175,1.625) J1(-6.175,0.975) J2(-5.525,0.975) J3(-4.875,0.975) J4(-4.225,0.975) J5(-3.575,0.975) J6(-2.925,0.975) J7(-2.275,0.975) J8(-1.625,0.975) J9(-0.975,0.975) J10(-0.325,0.975) J11(0.325,0.975) J12(0.975,0.975) J13(1.625,0.975) J14(2.275,0.975) J15(2.925,0.975) J16(3.575,0.975) J17(4.225,0.975) J18(4.875,0.975) J19(5.525,0.975) J20(6.175,0.975) K1(-6.175,0.325) K2(-5.525,0.325) K3(-4.875,0.325) K4(-4.225,0.325) K5(-3.575,0.325) K6(-2.925,0.325) K7(-2.275,0.325) K8(-1.625,0.325) K9(-0.975,0.325) K10(-0.325,0.325) K11(0.325,0.325) K12(0.975,0.325) K13(1.625,0.325) K14(2.275,0.325) K15(2.925,0.325) K16(3.575,0.325) K17(4.225,0.325) K18(4.875,0.325) K19(5.525,0.325) K20(6.175,0.325) L1(-6.175,-0.325) L2(-5.525,-0.325) L3(-4.875,-0.325) L4(-4.225,-0.325) L5(-3.575,-0.325) L6(-2.925,-0.325) L7(-2.275,-0.325) L8(-1.625,-0.325) L9(-0.975,-0.325) L10(-0.325,-0.325) L11(0.325,-0.325) L12(0.975,-0.325) L13(1.625,-0.325) L14(2.275,-0.325) L15(2.925,-0.325) L16(3.575,-0.325) L17(4.225,-0.325) L18(4.875,-0.325) L19(5.525,-0.325) L20(6.175,-0.325) M1(-6.175,-0.975) M2(-5.525,-0.975) M3(-4.875,-0.975) M4(-4.225,-0.975) M5(-3.575,-0.975) M6(-2.925,-0.975) M7(-2.275,-0.975) M8(-1.625,-0.975) M9(-0.975,-0.975) M10(-0.325,-0.975) M11(0.325,-0.975) M12(0.975,-0.975) M13(1.625,-0.975) M14(2.275,-0.975) M15(2.925,-0.975) M16(3.575,-0.975) M17(4.225,-0.975) M18(4.875,-0.975) M19(5.525,-0.975) M20(6.175,-0.975) N1(-6.175,-1.625) N2(-5.525,-1.625) N3(-4.875,-1.625) N4(-4.225,-1.625) N5(-3.575,-1.625) N6(-2.925,-1.625) N7(-2.275,-1.625) N8(-1.625,-1.625) N9(-0.975,-1.625) N10(-0.325,-1.625) N11(0.325,-1.625) N12(0.975,-1.625) N13(1.625,-1.625) N14(2.275,-1.625) N15(2.925,-1.625) N16(3.575,-1.625) N17(4.225,-1.625) N18(4.875,-1.625) N19(5.525,-1.625) N20(6.175,-1.625) P1(-6.175,-2.275) P2(-5.525,-2.275) P3(-4.875,-2.275) P4(-4.225,-2.275) P5(-3.575,-2.275) P6(-2.925,-2.275) P7(-2.275,-2.275) P8(-1.625,-2.275) P9(-0.975,-2.275) P10(-0.325,-2.275) P11(0.325,-2.275) P12(0.975,-2.275) P13(1.625,-2.275) P14(2.275,-2.275) P15(2.925,-2.275) P16(3.575,-2.275) P17(4.225,-2.275) P18(4.875,-2.275) P19(5.525,-2.275) P20(6.175,-2.275) R1(-6.175,-2.925) R2(-5.525,-2.925) R3(-4.875,-2.925) R6(-2.925,-2.925) R7(-2.275,-2.925) R8(-1.625,-2.925) R9(-0.975,-2.925) R10(-0.325,-2.925) R11(0.325,-2.925) R12(0.975,-2.925) R13(1.625,-2.925) R14(2.275,-2.925) R15(2.925,-2.925) R16(3.575,-2.925) R17(4.225,-2.925) R18(4.875,-2.925) R19(5.525,-2.925) R20(6.175,-2.925) T1(-6.175,-3.575) T2(-5.525,-3.575) T3(-4.875,-3.575) T7(-2.275,-3.575) T8(-1.625,-3.575) T9(-0.975,-3.575) T10(-0.325,-3.575) T11(0.325,-3.575) T12(0.975,-3.575) T13(1.625,-3.575) T14(2.275,-3.575) T15(2.925,-3.575) T16(3.575,-3.575) T17(4.225,-3.575) T18(4.875,-3.575) T19(5.525,-3.575) T20(6.175,-3.575) U1(-6.175,-4.225) U2(-5.525,-4.225) U3(-4.875,-4.225) U6(-2.925,-4.225) U7(-2.275,-4.225) U8(-1.625,-4.225) U9(-0.975,-4.225) U10(-0.325,-4.225) U11(0.325,-4.225) U12(0.975,-4.225) U13(1.625,-4.225) U14(2.275,-4.225) U15(2.925,-4.225) U16(3.575,-4.225) U17(4.225,-4.225) U18(4.875,-4.225) U19(5.525,-4.225) U20(6.175,-4.225) V1(-6.175,-4.875) V2(-5.525,-4.875) V3(-4.875,-4.875) V4(-4.225,-4.875) V5(-3.575,-4.875) V6(-2.925,-4.875) V7(-2.275,-4.875) V8(-1.625,-4.875) V9(-0.975,-4.875) V10(-0.325,-4.875) V11(0.325,-4.875) V12(0.975,-4.875) V13(1.625,-4.875) V14(2.275,-4.875) V15(2.925,-4.875) V16(3.575,-4.875) V17(4.225,-4.875) V18(4.875,-4.875) V19(5.525,-4.875) V20(6.175,-4.875) W1(-6.175,-5.525) W2(-5.525,-5.525) W3(-4.875,-5.525) W4(-4.225,-5.525) W5(-3.575,-5.525) W6(-2.925,-5.525) W7(-2.275,-5.525) W8(-1.625,-5.525) W9(-0.975,-5.525) W10(-0.325,-5.525) W11(0.325,-5.525) W12(0.975,-5.525) W13(1.625,-5.525) W14(2.275,-5.525) W15(2.925,-5.525) W16(3.575,-5.525) W17(4.225,-5.525) W18(4.875,-5.525) W19(5.525,-5.525) W20(6.175,-5.525) Y1(-6.175,-6.175) Y2(-5.525,-6.175) Y3(-4.875,-6.175) Y4(-4.225,-6.175) Y5(-3.575,-6.175) Y6(-2.925,-6.175) Y7(-2.275,-6.175) Y8(-1.625,-6.175) Y9(-0.975,-6.175) Y10(-0.325,-6.175) Y11(0.325,-6.175) Y12(0.975,-6.175) Y13(1.625,-6.175) Y14(2.275,-6.175) Y15(2.925,-6.175) Y16(3.575,-6.175) Y17(4.225,-6.175) Y18(4.875,-6.175) Y19(5.525,-6.175) Y20(6.175,-6.175)
LED0402-RD
  rect 0.636x0.54 smd: 1(-0.538,0) 2(0.538,0)
M3螺丝
  round 3.2 hole 3.2: 1(0,0)
OSC-SMD_L3.2-W1.5
  rect 1.05x1.7 smd: 1(-1.275,0) 2(1.275,0)
R0201
  rect 0.303x0.324 smd: 1(-0.241,0) 2(0.241,0)
R0201_1
  rect 0.305x0.305 smd: 1(0,0.305) 2(0,-0.305)
R0402
  rect 0.566x0.54 smd: 1(-0.433,0) 2(0.433,0)
R0402_1
  rect 0.566x0.54 smd: 1(-0.433,0) 2(0.433,0)
R0402_3
  rect 0.566x0.54 smd: 1(-0.433,0) 2(0.433,0)
R0603
  rect 0.806x0.864 smd: 1(-0.753,0) 2(0.753,0)
SMA_L4.3-W2.7-LS5.1-RD
  rect 2.1x1.8 smd: 1(-2.4,0) 2(2.4,0)
SOT23-5
  rect 0.55x1.45 smd: 1(-0.95,-1.075) 2(0,-1.075) 3(0.95,-1.075) 4(0.95,1.075) 5(-0.95,1.075)
SOT-23-3_L3.0-W1.7-P0.95-LS2.9-BR
  rect 1.038x0.532 smd: 1(1.101,-0.95) 2(1.101,0.95) 3(-1.101,0)
SOT-23-5_L3.0-W1.7-P0.95-LS2.8-BR
  rect 1.1x0.6 smd: 1(1.3,-0.95) 2(1.3,0) 3(1.3,0.95) 4(-1.3,0.95) 5(-1.3,-0.95)
SOT-23-6_L2.9-W1.6-P0.95-LS2.8-BL
  rect 0.532x1.072 smd: 1(-0.95,-1.149) 2(0,-1.149) 3(0.95,-1.149) 4(0.95,1.149) 5(0,1.149) 6(-0.95,1.149)
SOT-23-6_L2.9-W1.6-P0.95-LS2.8-BR
  rect 1.1x0.6 smd: 1(1.35,-0.95) 2(1.35,0) 3(1.35,0.95) 4(-1.35,0.95) 5(-1.35,0) 6(-1.35,-0.95)
SW-SMD_4P-L4.2-W3.3-P2.15-LS4.6
  rect 1.2x0.65 smd: 1(-2.15,1.075) 2(2.15,1.075) 3(-2.15,-1.075) 4(2.15,-1.075)
Test-Point-0.5mm
  round 0.5 smd: 1(0,0)
Test-Point-0.5mm_1
  rect 2.032x3.048 smd: 1(0,0)
TF-SMD_XKTF-015-N
  rect 0.7x1.6 smd: 1(2.25,5.3) 2(1.15,5.3) 3(0.05,5.3) 4(-1.05,5.3) 5(-2.15,5.3) 6(-3.25,5.3) 7(-4.35,5.3) 8(-5.45,5.3) 9(-6.55,5.3)
  rect 1.2x1.5 smd: 10(-7.75,4.3)
  rect 1.2x2.2 smd: 11(-7.75,-5.3) 13(7.75,-5.3)
  rect 1.6x1.5 smd: 12(6.85,4.3)
TYPE-C-SMD_HX-TYPE-C-16PIN
  oval 1x2 hole 0.6x1.7: 1(-4.32,1.816) 2(4.32,1.816)
  oval 1x1.8 hole 0.6x1.4: 3(-4.32,-2.384) 4(4.32,-2.384)
  rect 0.5x1.14 smd: A1B12(-3.2,2.384) A4B9(-2.4,2.384) A9B4(2.4,2.384) A12B1(3.2,2.384)
  rect 0.3x1.14 smd: A5(-1.25,2.383) A6(-0.25,2.383) A7(0.25,2.383) A8(1.25,2.384) B5(1.75,2.383) B6(0.75,2.383) B7(-0.75,2.383) B8(-1.75,2.384)
XTAL_3225
  rect 1.2x1 smd: 1(1.2,0.9) 2(-1.2,0.9) 3(-1.2,-0.9) 4(1.2,-0.9)

## Nets
As in the schematic, except:
GND: 3.3V.1 BOOT0.3 BOOT0.4 C1.2 C2.2 C3.2 C7.1 C8.1 C10.1 C11.1 C13.2 C14.2 C16.2 C17.2 C18.2 C19.2 C20.2 C22.2 C23.2 C24.2 C25.1 C26.2 C27.2 C29.2 C30.2 C31.2 C32.1 C33.2 C34.2 C36.2 C37.2 C38.2 C39.1 C40.1 C41.1 C42.1 C43.1 C44.1 C46.2 C47.2 C48.2 C50.2 C51.2 C52.2 C53.2 C54.2 C55.2 C56.2 C57.2 C60.2 C61.2 C62.2 C63.2 C64.2 C65.2 C66.2 C67.2 C68.2 C69.2 C70.2 C71.2 C72.2 C73.2 C74.2 C75.2 C76.2 C77.2 C78.2 C79.2 C80.2 C81.2 C82.2 C83.2 C84.2 C85.2 C86.2 C87.2 C88.2 C89.2 C90.2 C91.2 C92.2 C93.2 C94.2 C95.2 C96.2 C97.2 C99.2 C100.2 C101.2 C102.2 C103.2 C104.2 C105.2 C106.2 C107.2 C108.2 C109.2 C110.2 C111.2 C112.2 C113.2 C114.2 C115.2 C116.2 C117.2 C118.2 C119.2 C120.2 C121.2 C122.2 C123.2 C124.2 C125.2 C126.2 C127.2 C128.2 C129.2 C130.2 C131.2 C132.2 C133.2 C134.2 C135.2 C136.2 C137.2 C138.2 C139.2 C140.2 C141.2 C142.2 C143.2 C144.2 C145.2 C146.2 C147.2 C148.2 C149.2 C150.2 C151.2 C152.2 C153.2 C154.2 C155.2 C156.2 C157.2 C158.2 C159.2 C160.2 C161.2 C162.2 C163.1 C164.1 C190.2 C191.2 CARD1.6 CARD1.10 CARD1.11 CARD1.12 CARD1.13 CN2.1 CN2.4 CN2.5 CN2.6 CN3.1 CN3.4 CN3.5 CN3.6 D1.2 D3.2 D5.1 D6.1 D7.1 D8.1 FPC7.4 FPC7.7 FPC7.10 FPC7.13 FPC7.16 FPC7.19 FPC7.22 FPC7.23 FPC7.24 H1.3 R1.2 R2.2 R3.2 R9.1 R11.1 R14.2 R17.2 R20.2 R23.2 R24.2 R27.2 R30.2 R31.2 R36.1 R37.2 R38.2 R40.2 R44.2 R45.1 RST.3 RST.4 TP25.1 U1.1 U1.2 U1.3 U1.4 U1.A1B12 U1.A12B1 U2.2 U6.1 U7.2 U8.2 U9.2 U10.2 U11.1 U12.2 U22.A9 U22.A13 U22.A16 U22.A19 U22.B13 U22.B20 U22.C13 U22.D9 U22.D10 U22.D11 U22.D13 U22.D15 U22.E4 U22.E6 U22.E7 U22.E8 U22.E12 U22.E13 U22.E14 U22.E15 U22.E16 U22.E19 U22.F4 U22.F6 U22.F10 U22.F11 U22.F16 U22.G6 U22.G7 U22.G13 U22.G14 U22.G15 U22.G16 U22.H7 U22.H11 U22.H13 U22.H15 U22.H16 U22.H20 U22.J7 U22.J11 U22.J13 U22.J15 U22.K3 U22.K6 U22.K8 U22.K10 U22.K12 U22.K14 U22.K16 U22.K18 U22.L7 U22.L8 U22.L10 U22.L12 U22.L15 U22.L19 U22.M6 U22.M8 U22.M10 U22.M12 U22.M15 U22.M16 U22.N3 U22.N5 U22.N8 U22.N10 U22.N12 U22.N15 U22.N16 U22.P6 U22.P7 U22.P8 U22.P10 U22.P12 U22.P14 U22.P15 U22.P20 U22.R3 U22.R6 U22.R7 U22.R10 U22.R12 U22.R14 U22.R16 U22.T3 U22.T7 U22.T8 U22.T9 U22.T15 U22.U3 U22.U8 U22.U19 U22.V3 U22.V4 U22.V5 U22.V6 U22.V7 U22.V8 U22.W1 U22.W16 U22.W20 U22.Y13 U22.Y19 U23.A3 U23.A10 U23.AB3 U23.AB5 U23.AB8 U23.AB10 U23.C1 U23.C5 U23.C8 U23.C12 U23.D2 U23.D4 U23.D9 U23.D11 U23.E1 U23.E5 U23.E8 U23.E12 U23.G1 U23.G3 U23.G5 U23.G8 U23.G10 U23.G12 U23.J1 U23.J3 U23.J10 U23.J12 U23.K2 U23.K4 U23.K9 U23.K11 U23.N2 U23.N4 U23.N9 U23.N11 U23.P1 U23.P3 U23.P10 U23.P12 U23.T1 U23.T3 U23.T5 U23.T8 U23.T10 U23.T12 U23.V1 U23.V5 U23.V8 U23.V12 U23.W2 U23.W4 U23.W9 U23.W11 U23.Y1 U23.Y5 U23.Y8 U23.Y12 Y2.2 Y2.4
BOOT0: BOOT0.1 BOOT0.2 R33.2 R37.1 U22.C8
RSTN: C46.1 R32.2 RST.1 RST.2 U22.B9
$5N1745: C7.2 C8.2 D3.1 F1.2 R7.2 U6.3
$5N2049: R7.1 R9.2 U6.5
$5N2183: C9.2 U6.6
$5N2742: C12.1 R10.1 R11.2 U6.4
$7N7783: 3.3V.2 R73.1

Pads without a net: CARD1 9; FPC7 8 9 11 12; SCREW1 1; SCREW2 1; SCREW3 1; SCREW4 1; U1 A8 B8; U22 A7 A10 A11 A20 B6 B7 B10 C7 C10 C11 C20 D7 D8 D12 D19 D20 E1 E2 F18 G17 H18 H19 J17 J19 K20 L17 L18 L20 M17 M20 N18 P18 T19 U6 V12 Y1 Y20; U23 A1 A2 A8 A11 A12 AA1 AA12 AB1 AB2 AB11 AB12 B1 B12 G11 H3 J5 K5 K8 N5 N8 P5 R3

## Via types
v1: diameter 0.4, hole 0.305, Top Layer to Bottom Layer, 507 vias

## Routing (per net, layer and track width the routed paths; a pad name or vN(x,y) marks a point on that pad's centre or on a via; arc(x,y) is an arc through that point)
AGND: length 13
  Top Layer w0.102: U22.G8 15.16,25.14 13.38,25.14 13.2,24.97 13.2,24.8 12.9,24.49 10.7,24.49 10.28,24.07 9.16,24.07 6.53,26.69 6.53,28.99 C45.1
AVDD0P8_MIPI: length 2.7
  Bottom Layer w0.254: B4.2 15.58,19.1 15.07,19.61 ; v1(14.23,20.97) 14.34,20.85 14.34,20.46 15.09,19.71 v1(15.27,19.71)
AVDD1P8_MIPI: length 13
  Bottom Layer w0.203: 14.33,21.53 14.67,21.19 14.67,21.09 v1(14.84,20.93)
  Bottom Layer w0.254: 14.33,21.49 14.33,21.53 14.31,21.53 13.77,22.07 ; v1(16.27,19.48) 16.23,19.44 16.23,18.8 15.94,18.51 14.3,18.51 13.98,18.83 13.98,20.39 13.77,20.59 13.77,22.07 ; 13.77,22.07 13.77,22.09 13.26,22.6 13.26,24.61 13.94,25.29 14.33,25.29 14.83,24.78
AVDD_0V8_PLL: length 0.5
  Bottom Layer w0.254: v1(17.4,24.85) 17.48,24.94 17.48,25.27
GND: length 219.6
  Top Layer w0.152: v1(25.73,27.25) 24.69,28.3 24.33,28.3 24.19,28.16 24.12,28.16 23.91,27.95 23.91,27.67 23.36,27.12 23.12,27.12 22.93,26.93 22.93,26.64 22.6,26.3 U22.E19 ; U22.A9 16.1,29.3 16.02,29.37 16.02,30.04 v1(15.75,30.31) ; v1(23.1,8.73) 25.68,8.73 R38.2 ; v1(22.84,9.56) 23.18,9.89 25.32,9.89 27.11,11.67 R37.2
  Top Layer w0.203: U23.C12 26.71,16.99 26.65,16.93 26.23,16.93 25.82,17.33 25.48,17.33 v1(25.42,17.39) ; U23.T12 26.59,25.44 25.76,26.27 25.76,27.1 25.82,27.16
  Top Layer w0.254: 15.26,34.87 15.53,34.61 15.53,32.92 ; 15.26,34.87 15.16,34.97 15.12,34.97 ; 15.26,34.87 v1(16.49,34.87) ; 15.53,32.92 15.32,32.71 15.32,31.69 14.69,31.05 v1(14.69,29.78) 15.22,30.31 v1(15.75,30.31) ; 15.53,32.92 15.56,32.89 19.19,32.89 19.37,32.71 19.37,30.83 18.85,30.3 C42.1 ; U22.G16 U22.F16 20.47,25.68 20.47,25.97 U22.E16 ; U22.G16 U22.G15 ; U22.G16 U22.H16 U22.H15 ; U23.J3 33.89,20.89 v1(33.66,20.65) ; v1(18.45,27.03) 18.7,27.28 ; 18.7,27.28 U22.D13 ; 18.7,27.28 U22.C13 U22.B13 U22.A13 ; U22.R7 U22.P7 ; U22.R7 U22.R6 ; U22.R7 U22.T7 U22.T8 ; U22.P7 v1(15.45,20.3) 15.44,20.3 v1(15.44,20.94) 15.44,21.6 v1(15.45,21.6) v1(15.45,22.25) ; U22.P7 U22.P6 ; U22.E12 18.69,26.15 v1(18.72,26.12) 19.32,26.12 U22.E14 U22.E15 U22.D15 ; v1(29.11,23.45) 29.17,23.45 29.18,23.47 ; U22.T8 U22.U8 U22.V8 ; U22.T8 U22.T9 ; U1.2 9.27,37.75 9.82,37.75 9.82,36.03 10.04,35.81 R3.2 ; 25.82,27.16 26.08,26.9 26.49,26.9 26.65,26.74 U23.V12 ; v1(26.85,28.1) 26.91,28.1 27.37,27.64 27.37,27.58 U23.W11 ; FPC7.7 4.61,19.2 3.99,19.82 v1(3.99,20.01) 3.3,20.7 FPC7.10 ; 15.12,34.97 14.94,34.79 12.01,34.79 ; 15.12,34.97 R2.2 ; U23.A3 34.28,15.69 v1(34.31,15.71) ; RST.4 17.29,12.99 v1(18.05,12.99) ; v1(29.58,35.27) 29.58,35.91 R24.2 ; U22.E6 U22.E4 12.92,26.08 v1(12.92,25.89) 12.92,25.57 U22.F4 ; U22.E6 U22.F6 ; U22.E6 v1(14.8,26.15) U22.E8 ; v1(16.96,25.4) 17.06,25.5 U22.F11 ; v1(19.96,23.55) 20,23.58 U22.H15 ; U23.N9 29.18,23.47 ; 29.18,23.47 29.04,23.47 28.36,24.14 U23.P10 ; U23.N4 33.28,23.37 v1(33.28,22.81) ; U22.A16 20.65,29.34 v1(20.64,29.35) ; U23.AB5 32.36,29.4 32.99,30.03 33.15,30.03 v1(33.18,30.06) ; v1(35.92,24.04) 35.82,24.14 U23.P1 ; U23.K4 33.16,21.78 v1(33.14,21.8) ; CN3.1 10.57,5.71 9.99,6.29 9.99,6.81 10.47,7.3 10.59,7.3 D8.1 ; v1(37.05,26.14) 36.67,26.52 35.78,26.52 U23.V1 ; v1(12,34.05) 12.01,34.06 12.01,34.79 ; v1(17.4,24.2) v1(17.4,23.55) v1(18.05,22.9) v1(18.05,22.25) v1(18.05,21.6) v1(18.05,20.95) v1(18.05,20.3) v1(18.05,19.65) ; CN2.5 24.81,1.61 v1(8.64,1.61) ; U23.V5 32.33,26.7 v1(32.33,26.54) ; v1(29.38,21.31) 29.16,21.53 U23.K9 29.13,21.54 28.48,20.89 U23.J10 ; U22.L19 22.52,22.25 v1(21.95,22.82) ; v1(19.99,20.96) 20,20.97 20,21.6 ; v1(19.99,20.96) 19.99,20.31 U22.P15 ; v1(19.99,20.96) 20.64,20.96 U22.N16 U22.M16 20,21.6 20,21.6 ; U23.G10 28.63,19.59 v1(28.71,19.67) ; U22.P15 v1(19.34,20.3) ; U22.P15 U22.R16 ; U22.W1 10.86,17.08 9.45,17.08 v1(9.03,16.66) ; v1(30.28,18.24) 30.23,18.29 U23.E8 ; U22.R10 v1(16.75,20.3) v1(16.75,20.95) v1(16.75,21.6) v1(16.75,22.25) v1(16.75,22.9) ; CN3.4 14.32,6.12 14.57,6.38 14.57,7.11 14.44,7.24 14.43,7.24 v1(14.05,7.62) ; U23.T5 32.32,25.4 31.65,25.4 v1(31.57,25.48) ; 12.01,34.79 11.29,34.79 11.11,34.61 11.11,31.65 11.39,31.37 11.69,31.37 12.06,31 12.06,30.29 C43.1 ; U1.1 16.78,37.75 16.22,37.75 ; v1(22.67,16.08) 22.67,16.33 U22.Y19 22.79,16.6 22.83,16.6 23.1,16.86 23.1,16.9 U22.W20 ; U22.G15 U22.H15 ; U22.G15 U22.G14 v1(18.7,24.85) v1(18.7,24.2) v1(18.7,23.55) 18.7,23.54 19.34,22.9 U22.K14 ; R1.2 22.4,35.32 v1(22.26,35.18) ; BOOT0.3 8.16,13.1 v1(7.98,12.92) ; U23.P12 26.62,24.28 v1(26.38,24.28) ; U23.V8 30.18,26.52 30.37,26.52 30.64,26.25 30.64,26.25 v1(30.79,26.11) ; v1(14.79,22.29) 14.64,22.14 14.6,22.14 14.15,21.68 U22.M6 ; v1(15.45,22.25) v1(15.45,22.9) ; v1(15.45,22.25) U22.L7 ; 20,21.6 v1(19.99,21.59) ; U22.R3 U22.T3 U22.U3 12.28,18.27 v1(12.28,17.79) 12.72,17.79 12.79,17.71 12.83,17.71 U22.V4 ; 32.37,26.75 32.35,26.77 ; U22.V5 v1(13.89,17.7) U22.V6 U22.V7 ; v1(25.23,18.17) 25.47,17.93 25.59,17.93 25.79,17.72 26.19,17.72 U23.E12 ; U23.E1 35.58,18.27 v1(36.13,18.27) ; v1(30.53,25.55) 30.07,25.55 U23.T8 ; U23.AB10 28.36,30.18 v1(28.29,30.25) ; v1(37.89,21.77) 38.36,22.24 C39.1 ; C1.2 21.29,35.21 U2.2 ; v1(20,22.25) U22.M15 ; C50.2 9.37,24.81 C51.2 ; v1(29.19,14.45) 29.19,14.42 27.67,12.89 C46.2 ; v1(27.11,20.92) 27.07,20.89 U23.J12 ; v1(2.84,12.84) 3.06,12.84 3.3V.1 ; R23.2 37.76,24.32 37.64,24.2 37.64,23.33 ; v1(30.64,20.21) 30.58,20.21 30.45,20.08 30.44,20.08 30.15,19.8 30.15,19.78 U23.G8 ; v1(26.87,7.64) 26.87,8.59 C99.2 ; U23.D9 29.46,17.64 30.05,17.04 v1(30.09,17.04) ; v1(14.8,23.55) U22.H7 U22.G7 U22.G6 ; v1(34.76,27.41) 34.91,27.57 34.91,27.63 35.32,28.04 U23.Y1 ; v1(19.86,6.65) 19.86,5.75 CN2.1 ; U23.Y8 30.08,28.15 v1(30.61,28.15) ; U23.N11 27.62,23.43 v1(27.71,23.43) ; U22.T15 19.96,19 19.81,19.14 19.79,19.14 19.53,19.41 19.53,19.43 v1(19.34,19.62) ; R31.2 8.11,27.71 v1(7.99,27.83) 8.48,28.32 R27.2 ; v1(2.17,17.69) 2.93,17.69 FPC7.4 ; U23.AB8 29.96,30.1 v1(29.85,30.21) ; U22.A19 22.6,28.76 v1(22.89,29.06) 22.89,29.12 23.4,29.12 23.62,28.9 23.62,28.6 23.25,28.23 U22.B20 ; v1(23.1,8.73) 23.1,6.83 D5.1 22.85,5.54 CN2.4 ; U23.G5 32.44,19.51 v1(32.44,19.45) ; v1(4.01,29.84) 4.01,28.61 FPC7.23 3.89,27.65 FPC7.22 ; v1(27.48,21.42) 27.56,21.5 U23.K11 ; D1.2 9.92,33.63 v1(9.99,33.69) ; 17.4,26.8 v1(16.87,26.8) ; R9.1 33.38,42.1 33.39,42.1 33.53,41.97 33.53,41.21 33.15,40.83 R11.1 ; U23.G12 26.33,19.59 26,19.91 v1(26,20.14)
  Bottom Layer w0.203: v1(18.7,23.55) 19.2,23.04 C84.2
  Bottom Layer w0.254: v1(14.46,19) 14.46,19.5 C164.1 ; C145.2 31.68,20.23 C126.2 ; C85.2 19.8,24.23 19.8,24.39 19.54,24.66 18.89,24.66 v1(18.7,24.85) ; C127.2 29.33,21.36 v1(29.38,21.31) ; C121.2 29.51,18.75 29.81,18.45 30.07,18.45 v1(30.28,18.24) ; 29.83,17.62 29.93,17.52 29.93,17.36 30.09,17.21 v1(30.09,17.04) ; v1(30.53,25.55) 30.52,25.55 C113.2 ; C83.2 25.28,20.86 v1(26,20.14) ; C55.2 19.46,20.18 v1(19.34,20.3) ; v1(22.89,29.06) 23.21,28.74 23.21,28.46 23.23,28.44 23.23,28.06 23.21,28.04 23.21,26.77 ; v1(28.29,30.25) 28.38,30.16 C125.2 ; v1(31.34,17.78) 31.34,18.5 31.23,18.61 ; C47.2 16.98,26.7 v1(16.87,26.8) ; 36.44,20.4 37.8,20.4 C104.2 ; 36.44,20.4 36.38,20.4 ; 36.44,20.4 36.47,20.38 ; C94.2 14.83,26.07 C97.2 ; C124.2 34.8,25.95 v1(35.41,25.34) ; C163.1 15.4,20.4 C64.2 ; C103.2 19.39,26.08 C96.2 18.77,26.07 v1(18.72,26.12) ; R30.2 v1(14.8,26.15) ; v1(4.73,33.49) 5.36,33.49 5.79,33.06 5.79,32.98 R14.2 ; C61.2 17.38,24.18 v1(17.4,24.2) ; C128.2 29.85,29.62 v1(29.85,30.21) ; v1(26.85,28.1) 26.8,28.14 C132.2 ; v1(4.82,24.88) 4.82,23.65 C27.2 5.29,23.58 v1(5.88,22.98) ; v1(26.38,24.28) 26.35,24.25 25.44,24.25 25.25,24.44 25.25,24.45 24.89,24.8 ; 31.16,24.61 31.16,24.85 31.34,25.04 31.49,25.04 31.57,25.11 ; v1(16.75,20.3) 16.75,19.66 16.72,19.64 ; 31.57,25.11 v1(31.57,25.48) ; 31.57,25.11 C160.2 ; C91.2 14.67,23.68 v1(14.8,23.55) ; v1(30.61,28.15) 30.58,28.13 C130.2
  Bottom Layer w0.889: C29.2 8.3,16.73 C31.2 C30.2
  vias: v1(1.91,3.38) v1(2.37,23.72) v1(3.14,13.77) v1(3.98,30.52) v1(4.54,22.19) v1(4.6,35.44) v1(4.64,34.82) v1(4.73,34.17) v1(4.94,27.76) v1(5.89,28.25) v1(5.91,27.54) v1(5.86,19.65) v1(6.04,14.79) v1(6.05,14.01) v1(7.41,28.13) v1(7.41,16.68) v1(7.82,16.24) v1(8.3,16.87) v1(8.43,9.5) v1(9.28,25.19) v1(10.85,7.55) v1(12.2,22.9) v1(12.27,21.04) v1(12.91,13.98) v1(13.32,20.95) v1(13.93,32.81) v1(13.96,22.88) v1(14.82,24.2) v1(16.07,26.76) v1(16.23,9.75) v1(17.55,2.61) v1(18.66,16.37) v1(20.51,38.87) v1(20.53,38.17) v1(20.51,37.52) v1(20.64,17.05) v1(20.72,22.88) v1(21.4,37.56) v1(21.64,35.17) v1(22.78,18.24) v1(23.24,24.2) v1(23.22,20.33) v1(25.19,37.57) v1(25.98,38.47) v1(26.02,36.86) v1(26.7,3.59) v1(26.77,37.65) v1(27.66,3.32) v1(27.78,17.53) v1(27.92,35.39) v1(28.26,25.51) v1(28.38,15.51) v1(28.73,35.29) v1(28.83,3.31) v1(29.15,8.41) v1(29.15,42.81) v1(29.36,27.44) v1(29.98,3.39) v1(30.06,7.24) v1(30.7,17.04) v1(30.84,39.7) v1(31.62,29.25) v1(32.24,18.27) v1(32.28,27.88) v1(32.5,17.05) v1(32.91,6.69) v1(33.19,27.39) v1(33.25,17.51) v1(33.28,42.52) v1(33.9,25.5) v1(33.96,29.31) v1(33.99,19.64) v1(34.08,24.07) v1(34.54,23.48) v1(34.8,21.7) v1(34.86,7.23) v1(35.03,17.62) v1(35.31,7.68) v1(35.57,21.05) v1(35.57,19.44) v1(35.56,17.11) v1(36.29,20.43) v1(36.29,7.1) v1(36.74,7.55) v1(37.18,38.06) v1(37.18,37.41) v1(37.64,23.33) v1(37.85,38.06) v1(37.85,37.41) v1(40.25,17.88) v1(40.23,16.73) v1(40.5,28.15) v1(40.5,27.35) v1(40.77,18.86) v1(40.82,18.18) v1(40.79,17.17) v1(41.31,26.95) v1(41.31,16.7) v1(41.38,18.86) v1(41.4,17.81) v1(41.5,23.07) v1(41.5,22.43) v1(42.74,39.05) v1(42.72,38.07) v1(42.71,37.13) v1(43.52,39.06) v1(43.54,38.04) v1(43.56,37.13)
VDD0V8_CORE: length 44.8
  Top Layer w0.254: U22.H10 v1(16.1,24.2) ; U22.H12 v1(18.05,24.85) U22.F12
  Inner2 w0.254: v1(16.75,23.55) v1(17.4,22.9) 18.04,23.54 v1(18.06,23.54) 18.7,22.91
  Inner2 w0.508: v1(18.7,20.3) v1(18.7,20.98) v1(18.7,21.59) v1(18.7,22.27) v1(18.7,22.9) ; v1(17.4,20.3) v1(17.4,20.93) v1(17.4,21.61) v1(17.4,22.22) v1(17.4,22.9) ; v1(16.1,20.3) v1(16.1,20.94) v1(16.1,21.62) v1(16.1,22.24) v1(16.1,22.88) v1(16.1,23.55)
  Inner2 w0.533: v1(18.06,23.54) 18.06,26.46 16.68,27.84
  Inner3 w0.254: v1(16.1,23.55) v1(16.75,23.55) 17.27,23.03 17.53,23.03 17.86,23.36 17.87,23.36 v1(18.06,23.54) 18.7,22.91 ; v1(17.4,20.3) 17.39,20.3 16.94,19.84 16.56,19.84 16.1,20.3 v1(16.1,20.3)
  Inner3 w0.508: v1(17.4,20.3) v1(17.4,20.93) v1(17.4,21.61) v1(17.4,22.22) v1(17.4,22.9) ; v1(18.7,20.3) v1(18.7,20.98) v1(18.7,21.59) v1(18.7,22.27) v1(18.7,22.9) ; v1(16.1,23.55) v1(16.1,24.2) v1(16.1,24.85)
  Inner3 w0.635: v1(16.1,24.85) 13.79,24.85 13.48,25.15 ; v1(16.1,20.3) v1(16.1,20.94) v1(16.1,21.62) v1(16.1,22.24) v1(16.1,22.88) v1(16.1,23.55)
  Bottom Layer w0.254: C64.1 15.99,20.02 15.8,19.83 ; 16.04,20.25 v1(16.1,20.3) ; 7.84,31.82 7.8,31.77 7.8,31.55 7.54,31.29 7.54,29.05 8.16,28.44 8.42,28.44 8.77,28.09 v1(8.77,26.68) ; 7.84,31.82 C15.1 ; 7.84,31.82 R13.1 ; v1(18.05,24.85) 18.09,24.9 18.09,25.27 ; v1(8.12,26.01) v1(8.12,26.61) 8.12,26.78 C60.1 ; C74.1 18.14,24.8 C72.1
  vias: v1(8.76,26.01) v1(9.5,26.63) v1(9.5,25.99) v1(15.45,24.2) v1(15.45,23.55) v1(16.75,24.83)
VDD_1V1: length 40.5
  Top Layer w0.152: R42.2 31.87,14.27 31.87,15.05 32.01,15.19 32.01,15.97 32.36,16.32 U23.B5
  Top Layer w0.254: U23.B5 32.14,16.56 v1(32,16.56) ; v1(31.65,26.39) 31.66,26.39 31.96,26.09 U23.U5 ; v1(34.33,19.13) 34.14,18.94 U23.F3 ; U23.K1 35.59,21.57 v1(35.59,21.79) 35.95,21.79 36.81,20.93 36.99,20.93 ; U23.D1 36.22,17.64 v1(36.25,17.66) ; U23.U3 34.25,26.09 v1(34.31,26.02) ; U23.N3 34.1,23.34 v1(34.1,22.84) ; v1(28.38,23.47) 28.36,23.49 U23.N10 ; U23.W12 26.63,27.25 26.46,27.25 v1(26.36,27.35) ; U23.R12 25.72,24.79 25.67,24.74 v1(25.67,24.71) ; U23.N12 26.7,23.43 v1(26.48,23.43) ; C21.1 30.72,8.48 R16.1 ; U23.D8 29.99,17.66 v1(30.48,17.66) ; U23.D5 32.06,17.64 v1(31.97,17.72) ; U23.D12 26.49,17.37 26.48,17.37 v1(26.47,17.36) ; U23.AB9 29.19,29.36 v1(29.19,30.25) ; U23.F10 28.37,18.94 v1(28.59,18.72) ; U23.F8 30.08,18.81 v1(30.49,18.81) ; U23.B3 34.29,16.34 v1(34.31,16.35) ; U23.N1 35.77,23.49 v1(35.84,23.42) ; 28.24,16.31 28.29,16.26 ; 28.24,16.31 v1(28.18,16.31) ; 28.24,16.31 28.39,16.31 28.57,16.13 28.72,16.13 U23.A9 ; U23.W8 30.56,27.39 v1(30.64,27.31) ; v1(26.72,21.42) 26.76,21.46 U23.K12 ; 28.36,21.54 28.36,21.42 v1(28.34,21.4) ; v1(30.65,24.64) 30.57,24.56 30.19,24.56 U23.R8 ; v1(31.97,28.69) 32.36,28.69 ; U23.R5 32.14,24.57 v1(31.64,24.57) ; U23.H12 26.76,20.21 v1(26.63,20.08) ; v1(30.64,16.23) 30.28,16.23 30.2,16.31 29.99,16.31 U23.B8 ; v1(35.82,24.8) 36.64,24.8 36.66,24.83 36.67,24.83 R41.2 ; v1(30.72,28.76) 30.03,28.76 U23.AA8
  Inner3 w0.127: v1(32.32,27.24) 32.19,27.24 32.01,27.42 31.81,27.42 31.81,27.42 30.75,27.42 v1(30.64,27.31)
  Inner3 w0.203: 20.67,21.29 20.67,21.04 20.16,20.53 19.81,20.53 19.79,20.55 19.75,20.55
  Inner3 w0.254: v1(19.35,20.95) 19.35,20.95 19.75,20.55
  Inner3 w0.508: v1(25.67,24.71) 25.04,25.34 20.49,25.34 v1(19.35,24.2) v1(19.35,23.55) 19.31,23.51 v1(19.31,22.25) 19.31,20.99 v1(19.35,20.95)
  Bottom Layer w0.254: v1(26.47,17.36) 26.11,17.36 C129.1 ; v1(26.48,23.43) 26.83,23.43 C118.1 ; v1(30.64,27.31) 30.54,27.41 C140.1 ; v1(29.19,30.25) 29.35,30.09 C128.1 ; C127.1 28.51,21.4 v1(28.34,21.4) ; v1(30.49,18.81) 30.48,18.83 C122.1 ; 30,28.61 30.15,28.76 v1(30.72,28.76)
  vias: v1(19.36,21.59) v1(25.96,4.77) v1(26.06,5.67) v1(26.86,5.95) v1(26.96,4.62) v1(27.65,5.59) v1(27.8,4.72) v1(28.29,26.12) v1(28.37,28.81) v1(29.27,15.27) v1(29.98,20.4) v1(30.15,26.06) v1(32.22,18.88) v1(32.31,20.36) v1(33.13,29.45) v1(33.08,15.66) v1(34,21.72) v1(34.1,28.72) v1(35.37,27.44) v1(35.55,20.41)
VDD_1V8: length 72.6
  Top Layer w0.254: U23.F1 36.17,18.94 36.4,19.17 v1(36.4,19.53) ; U23.F12 26.76,18.79 26.13,18.16 26.08,18.16 v1(26.04,18.21) ; U23.G9 29.42,19.59 v1(29.48,19.64) ; v1(38.29,16.21) 38.29,14.34 34.05,10.1 30.5,10.1 30.19,10.41 R32.1 ; v1(36.02,26.06) 35.99,26.09 U23.U1 ; v1(26.25,26.4) 26.56,26.09 U23.U12
  Bottom Layer w0.254: v1(29.11,25.51) 29.45,25.51 C113.1 ; 20.19,25.09 19.17,25.09 18.87,25.39 18.8,25.39 v1(18.7,25.5) 18.54,25.66 18.47,25.66 18.05,26.09 17.47,26.09 ; 20.19,25.09 20.57,25.47 21.57,25.47 22.09,25.98 25.84,25.98 v1(26.25,26.4) 26.25,26.47 26.97,27.18 28.07,27.18 29.5,25.75 C113.1 ; 20.19,25.09 20.27,25.01 B2.1 ; 17.29,26.09 17.18,26.09 16.94,25.85 16.48,25.85 16.13,25.5 ; B3.1 15.64,25.02 15.64,25.04 16.1,25.49 v1(16.1,25.5) 16.09,25.5 15.64,25.04 15.26,25.04 14.81,25.5 v1(14.81,25.54) ; v1(36.02,26.06) 36.35,26.06 37.88,24.53 v1(38.5,24.53) 38.89,24.14 38.89,22.6 ; C113.1 29.5,25.42 29.6,25.32 29.6,25.3 29.81,25.09 30.77,25.09 31.11,25.44 31.11,25.68 31.37,25.93 32.62,25.93 v1(33.06,25.5) 33.7,24.86 34.57,24.86 35.19,24.24 35.19,23.02 35.64,22.57 38.71,22.57 38.82,22.67 38.89,22.6 ; 38.89,22.6 38.89,21.14 38.82,21.07 38.82,19.28 v1(38.25,18.71) 37.5,18.71 36.68,19.53 v1(36.4,19.53) 36.02,19.91 34.55,19.91 34.36,20.1 33.8,20.1 33.21,19.51 v1(33.16,19.51) 33.13,19.54 33.09,19.54 32.73,19.9 31.97,19.9 31.72,19.65 29.48,19.65 v1(29.48,19.64) 29.02,19.18 28.31,19.18 27.77,18.63 26.46,18.63 v1(26.04,18.21)
  vias: v1(17.41,26.17) v1(38.94,16.17) v1(38.98,18.67) v1(39.34,24.54)
